# Altium project Gear_Trak-v1.0.PrjPcb (part 3 of 3)

## Sheet 3.MCU NRF52840.SchDoc: Thingy:91 nRF52840 MCU
size A4; Organization: Nordic Semiconductor; DocumentNumber: 3; SheetNumber: 3; SheetTotal: 6; CompanyName: Nordic Semiconductor; DocumentSize: A3; ProjectName: Gear_Trak-v1.0.PrjPcb
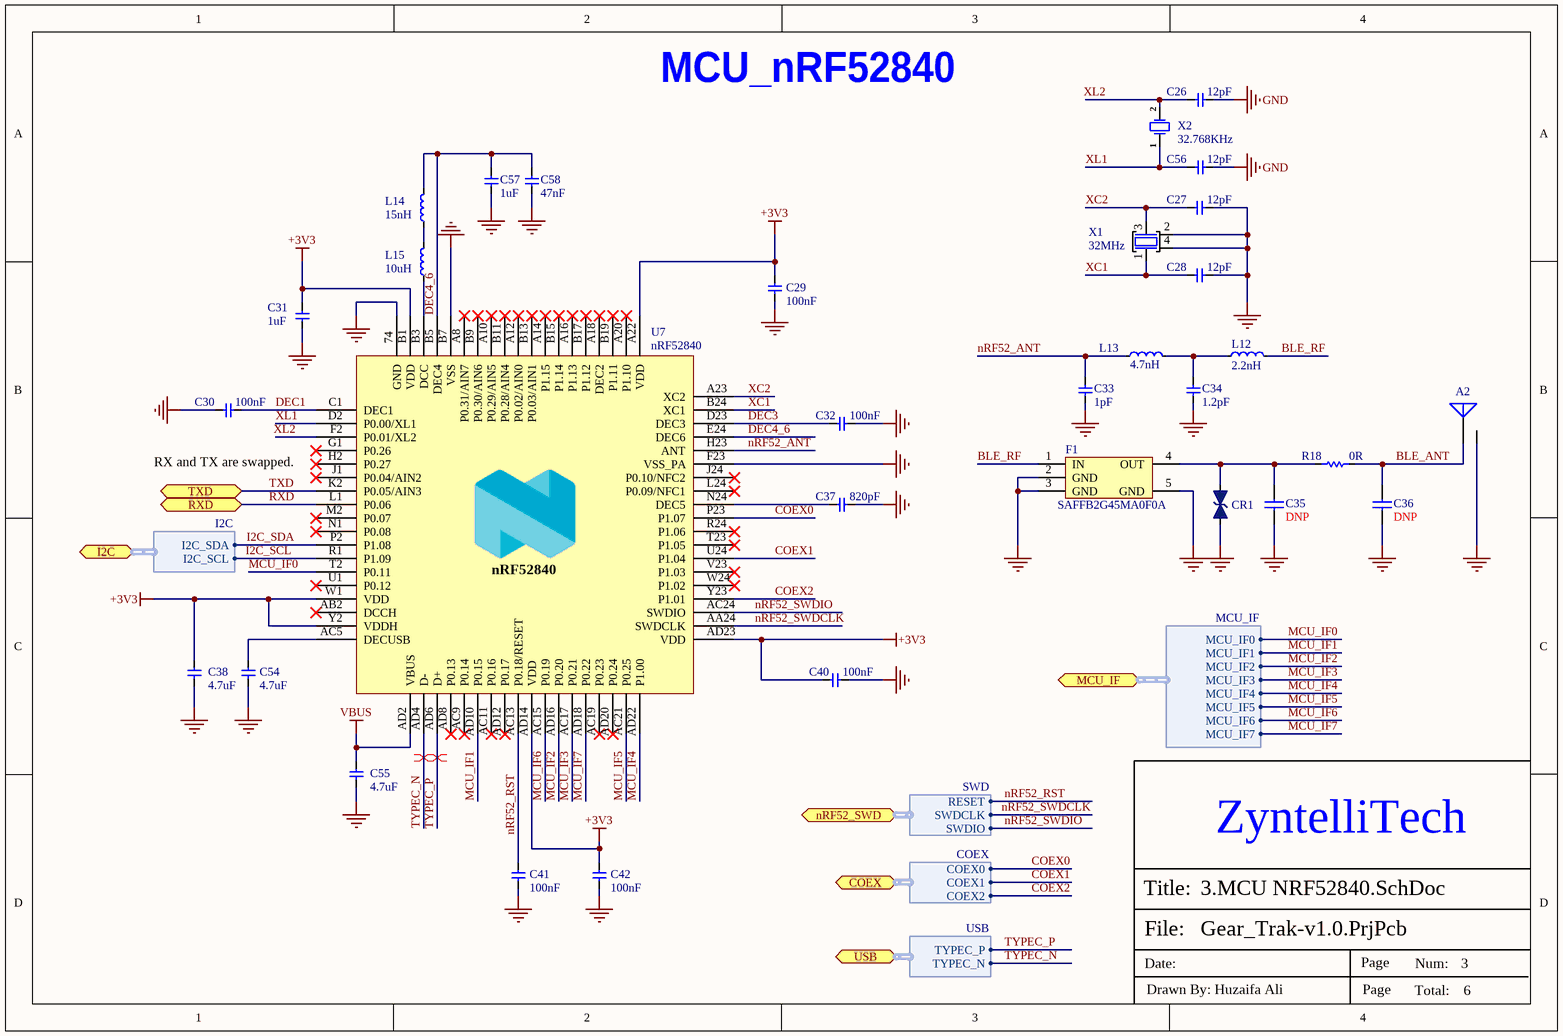
[diagram p3: 3.MCU NRF52840.SchDoc]

### Parts
A2  2450AT18D0100E  [2450AT18D0100E]  (value not drawn)
C26  12pF  [Cap-0402]
C27  12pF  [Cap-0402]
C28  12pF  [Cap-0402]
C29  100nF  [cap-0402]
C30  100nF  [cap-0402]
C31  1uF  [Cap-0402]
C32  100nF  [cap-0402]
C33  1pF  [Cap-0402]
C34  1.2pF  [Cap-0402]
C35  DNP  [CAPC0603X03L_C]
C36  DNP  [CAPC0603X03L_C]
C37  820pF  [Cap-0402]
C38  4.7uF  [Cap-0402]
C40  100nF  [cap-0402]
C41  100nF  [cap-0402]
C42  100nF  [cap-0402]
C54  4.7uF  [Cap-0402]
C55  4.7uF  [Cap-0402]
C56  12pF  [Cap-0402]
C57  1uF  [Cap-0402]
C58  47nF  [Cap-0402]
CR1  EZA-EG1N50AC  [RESC0603X03L_C]  (value not drawn)
F1  SAFFB2G45MA0F0A  [SAFFB2G45MA0F0A]
L12  2.2nH  [INDC0603X03L_C]
L13  4.7nH  [INDC0603X03L_C]
L14  15nH  [IND-0402]
L15  10uH  [IND-0603 (1608 Metric)]
R18  0R  [Res-0402]
U7  nRF52840  [AQFN50P700X700X85_HS-74N]
X1  32MHz  [BT-XTAL_2016]
X2  32.768KHz  [SMD3215-2P]

### Ports
COEX (bidir, harness COEX), I2C (bidir, harness I2C), MCU_IF (bidir, harness MCU_IF), nRF52_SWD (bidir, harness SWD), RXD (bidir), TXD (bidir), USB (bidir, harness USB)

### Harnesses
COEX: COEX2, COEX1, COEX0
SWD: SWDIO, SWDCLK, RESET
I2C: I2C_SCL, I2C_SDA
USB: TYPEC_N, TYPEC_P
MCU_IF: MCU_IF2, MCU_IF1, MCU_IF3, MCU_IF4, MCU_IF5, MCU_IF6, MCU_IF0, MCU_IF7

### Nets
+3V3: C29.1 C31.2 C38.1 C40.1 C42.1 U7.A22(VDD) U7.AD14(VDD) U7.AD23(VDD) U7.B1(VDD) U7.W1(VDD) U7.Y2(VDDH)
GND: A2.2(GND) C26.1 C27.2 C28.2 C29.2 C30.2 C31.1 C32.2 C33.1 C34.1 C35.1 C36.1 C37.2 C38.2 C40.2 C41.2 C42.2 C54.2 C55.2 C56.1 C57.1 C58.1 CR1.1 F1.2(GND) F1.3(GND) F1.5(GND) U7.74(GND) U7.B7(VSS) U7.F23(VSS_PA) X1.2(GND) X1.4(GND)
VBUS: C55.1 U7.AD2(VBUS)
BLE_ANT: A2.1(FEED) C36.2 R18.1
BLE_RF: F1.1(IN) L12.2
COEX0: U7.P23(P1.07) ; port COEX.COEX0
COEX1: U7.U24(P1.04) ; port COEX.COEX1
COEX2: U7.Y23(P1.01) ; port COEX.COEX2
DEC1: C30.1 U7.C1(DEC1)
DEC3: C32.1 U7.D23(DEC3)
DEC4_6: C57.2 C58.2 L14.2 U7.B5(DEC4) U7.E24(DEC6)
I2C_SCL: U7.R1(P1.09) ; port I2C.I2C_SCL
I2C_SDA: U7.P2(P1.08) ; port I2C.I2C_SDA
MCU_IF0: U7.T2(P0.11) ; port MCU_IF.MCU_IF0
MCU_IF1: U7.AD10(P0.15) ; port MCU_IF.MCU_IF1
MCU_IF2: U7.AD16(P0.20) ; port MCU_IF.MCU_IF2
MCU_IF3: U7.AC17(P0.21) ; port MCU_IF.MCU_IF3
MCU_IF4: U7.AD22(P1.00) ; port MCU_IF.MCU_IF4
MCU_IF5: U7.AC21(P0.25) ; port MCU_IF.MCU_IF5
MCU_IF6: U7.AC15(P0.19) ; port MCU_IF.MCU_IF6
MCU_IF7: U7.AD18(P0.22) ; port MCU_IF.MCU_IF7
nRF52_ANT: C33.2 L13.1 U7.H23(ANT)
nRF52_RST: C41.1 U7.AC13(P0.18/RESET) ; port nRF52_SWD.RESET
nRF52_SWDCLK: U7.AA24(SWDCLK) ; port nRF52_SWD.SWDCLK
nRF52_SWDIO: U7.AC24(SWDIO) ; port nRF52_SWD.SWDIO
RXD: U7.L1(P0.06) ; port RXD
TXD: U7.K2(P0.05/AIN3) ; port TXD
TYPEC_N: U7.AD4(D-) ; port USB.TYPEC_N
TYPEC_P: U7.AD6(D+) ; port USB.TYPEC_P
XC1: C28.1 U7.B24(XC1) X1.1(IN)
XC2: C27.1 U7.A23(XC2) X1.3(OUT)
XL1: C56.2 U7.D2(P0.00/XL1) X2.1(OSC1)
XL2: C26.2 U7.F2(P0.01/XL2) X2.2(OSC2)
NetC34_2: C34.2 L12.1 L13.2
NetC35_2: C35.2 CR1.2 F1.4(OUT) R18.2
NetC37_1: C37.1 U7.N24(DEC5)
NetC54_1: C54.1 U7.AC5(DECUSB)
NetL14_1: L14.1 L15.2
NetL15_1: L15.1 U7.B3(DCC)

Not connected (* = marked no-connect by the designer): U7 A8(P0.31/AIN7)* A10(P0.29/AIN5)* A12(P0.02/AIN0)* A14(P1.15)* A16(P1.13)* A18(DEC2)* A20(P1.10)* AB2(DCCH)* AC9(P0.14)* AC11(P0.16)* AC19(P0.23)* AD8(P0.13)* AD12(P0.17)* AD20(P0.24)* B9(P0.30/AIN6)* B11(P0.28/AIN4)* B13(P0.03/AIN1)* B15(P1.14)* B17(P1.12)* B19(P1.11)* G1(P0.26)* H2(P0.27)* J1(P0.04/AIN2)* J24(P0.10/NFC2)* L24(P0.09/NFC1)* M2(P0.07)* N1(P0.08)* R24(P1.06)* T23(P1.05)* U1(P0.12)* V23(P1.03)* W24(P1.02)*

### Layout directives
differential pair; differential pair class USB: TYPEC_N, TYPEC_P

### Notes on the sheet
- MCU_nRF52840
- RX and TX are swapped.
- ZyntelliTech
- File:
- Title:
- Date:
- Page
- Num:
- Total:
- Drawn By: Huzaifa Ali

### Library data of the parts
A2 = 2450AT18D0100E: 1.5dBi Chip Antenna 2.4GHz 2W 1206 Antennas ROHS; Manufacturer: Johanson; Item Type: RF Antennas; Clock Frequency: 2.5GHz; Supplier: Arrow Electronics; Supplier Part Number: 2450AT18D0100E; Manufacturer Part Number: 2450AT18D0100E; RoHS: Yes; Stock: 27000; Pricing: 3000=0.2354, 6000=0.2331, 9000=0.2244 (USD); Min Operating Temperature: -40°C; Max Operating Temperature: 125°C; ComponentLink1URL: https://datasheet.ciiva.com/29647/2450at18d0100-29647392.pdf?src-supplier=Digikey; ComponentLink1Description: https://datasheet.ciiva.com/29647/2450at18d0100-29647392.pdf?src-supplier=Digikey; ComponentLink2URL: https://datasheet.ciiva.com/24046/antenna-2450at18d0100-v3-258090-24046431.pdf?src-supplier=Mouser; ComponentLink2Description: https://datasheet.ciiva.com/24046/antenna-2450at18d0100-v3-258090-24046431.pdf?src-supplier=Mouser
C26-C28 C56 = GJM1555C1H120GB01D: CAP CER 12PF 50V C0G/NP0 0402; Manufacturer: Murata; Tolerance: 2%; Dielectric: C0G; ComponentLink1URL: https://datasheet.ciiva.com/11608/product-11608208.pdf?src-supplier=Avnet; ComponentLink1Description: https://datasheet.ciiva.com/11608/product-11608208.pdf?src-supplier=Avnet; ComponentLink2URL: https://datasheet.ciiva.com/29542/partnumbering-e-01-29542716.pdf?src-supplier=Digi-Key; ComponentLink2Description: https://datasheet.ciiva.com/29542/partnumbering-e-01-29542716.pdf?src-supplier=Digi-Key; Supplier 1: Digi-Key; Manufacturer Part Number: GJM1555C1H120GB01D; RoHS: Yes; Category: Ceramic Capacitors; Stock 1: 266975; Pricing 1: 1=0.18000, 10=0.12600, 50=0.07560, 100=0.06390, 500=0.04370, 1000=0.03865, 2500=0.03698, 5000=0.03361 (USD); Mount: Surface Mount; Case/Package: 0402; Case Code (Imperial): 0402; Case Code (Metric): 1005; Min Operating Temperature: -55°C; Max Operating Temperature: 125°C; Capacitance: 12pF; Voltage Rating: 50V; Voltage Rating (DC): 50V; Packaging: Tape and Reel; Package Quantity: 10000; Termination: SMD/SMT; Series: GJM; Construction: Flat; Length: 1mm; Width: 0.5mm; Height: 0.5mm; Thickness: 0.022inch; Depth: 0.5mm; Radiation Hardening: No; Lead Free: Lead Free; RoHS Compliant: Yes; ComponentLink3URL: https://datasheet.ciiva.com/29542/partnumbering-e-01-29542715.pdf?src-supplier=Digi-Key; ComponentLink3Description: https://datasheet.ciiva.com/29542/partnumbering-e-01-29542715.pdf?src-supplier=Digi-Key; ComponentLink4URL: https://datasheet.ciiva.com/29542/partnumbering-e-01-29542717.pdf?src-supplier=Digi-Key; ComponentLink4Description: https://datasheet.ciiva.com/29542/partnumbering-e-01-29542717.pdf?src-supplier=Digi-Key; Supplier Part Number 1: 490-8078-1-ND; LCSC Part Number: C161305
C29 C30 C32 C40-C42 = C1005X7R1H104KT000F: CAP CER 0.1UF 50V X7R 0402; Manufacturer: TDK; Tolerance: 10%; Voltage: 25V; Item Type: Capacitor; ComponentLink1URL: https://www.lcsc.com/product-detail/Multilayer-Ceramic-Capacitors-MLCC-SMD-SMT_TDK-C1005X7R1H104KT000F_C361198.html; ComponentLink1Description: LCSC; Supplier 1: Avnet; Manufacturer Part Number: C1005X7R1H104KT000F; RoHS: No; Category: Ceramic Capacitors; Dielectric: X7R; Supplier Part Number 1: C1005X7R1H104KT000F; LCSC Part Number: C361198
C31 = GRM155R70J105KA12J: CAP CER 1UF 6.3V X7R 0402; Manufacturer: Murata; Item Type: Capacitors; Material: 4241ConductorMaterial; Tolerance: 10%; Supplier: Mouser; LCSC Part Number: C2167130; Manufacturer Part Number: GRM155R70J105KA12J; RoHS: Yes; Stock: 273640; Pricing: 1=0.1, 10=0.01, 50=0.01, 100=0.008, 1000=0.008, 10000=0.007 (USD); Mounting Technology: Surface Mount; Case/Package: 0402; Pins: 2NUMBER; Case Code (Metric): 1005; Case Code (Imperial): 0402; Weight: 0.000212oz; Min Operating Temperature: -55°C; Max Operating Temperature: 125°C; Packaging: Tape and Reel; Value: 1uF; Voltage Rating: 6.3V; Dielectric: X7R; Termination: SMD/SMT; Voltage Rating (DC): 6.3V; Package Quantity: 50000; Series: GRM; Length: 0.039inch; Width: 0.02inch; Height: 550um; Thickness: 0.022inch; RoHS Compliant: Yes; ComponentLink1URL: http://www.mouser.com/ds/2/281/c02e-2905.pdf?src-supplier=Mouser; ComponentLink1Description: http://www.mouser.com/ds/2/281/c02e-2905.pdf?src-supplier=Mouser; ComponentLink2URL: https://datasheet.octopart.com/GRM155R70J105KA12J-Murata-datasheet-32479577.pdf?src-supplier=Future+Electronics; ComponentLink2Description: https://datasheet.octopart.com/GRM155R70J105KA12J-Murata-datasheet-32479577.pdf?src-supplier=Future+Electronics; ComponentLink3URL: https://datasheet.octopart.com/GRM155R70J105KA12J-Murata-datasheet-155345054.pdf?src-supplier=Element14; ComponentLink3Description: https://datasheet.octopart.com/GRM155R70J105KA12J-Murata-datasheet-155345054.pdf?src-supplier=Element14; ComponentLink4URL: http://search.murata.co.jp/Ceramy/image/img/A01X/G101/ENG/GRM155R70J105KA12-01.pdf?src-supplier=Digikey; ComponentLink4Description: http://search.murata.co.jp/Ceramy/image/img/A01X/G101/ENG/GRM155R70J105KA12-01.pdf?src-supplier=Digikey; ComponentLink5URL: https://datasheet.octopart.com/GRM155R70J105KA12J-Murata-datasheet-165579666.pdf?src-supplier=TME; ComponentLink5Description: https://datasheet.octopart.com/GRM155R70J105KA12J-Murata-datasheet-165579666.pdf?src-supplier=TME
C33 = CC0402BRNPO9BN1R0: CAP CER 1PF 50V C0G/NPO 0402; Manufacturer: Yageo; Temperature Coefficient: 30ppm/°C; Item Type: Capacitor; Supplier: Future Electronics; Supplier Part Number: 7847221; Manufacturer Part Number: CC0402BRNPO9BN1R0; RoHS: Yes; Category: Ceramic Capacitors; Stock: 180000; Pricing: 10000=0.0034, 40000=0.0032, 150000=0.0031, 250000=0.003, 500000=0.0028 (USD); Halogen Free: 5694HalogenFree; ComponentLink1URL: https://datasheet.ciiva.com/26862/getdatasheetpartid-403422-26862565.pdf?src-supplier=Verical; ComponentLink1Description: https://datasheet.ciiva.com/26862/getdatasheetpartid-403422-26862565.pdf?src-supplier=Verical; ComponentLink2URL: https://datasheet.ciiva.com/11587/upy-gp-np0-16v-to-50v-8-11587115.pdf?src-supplier=Avnet; ComponentLink2Description: https://datasheet.ciiva.com/11587/upy-gp-np0-16v-to-50v-8-11587115.pdf?src-supplier=Avnet; LCSC Part Number: C309455
C34 = CC0402BRNPO9BN1R2: CAP CER 1.2PF 50V C0G/NPO 0402; Manufacturer: Yageo; Item Type: Capacitor; Temperature Coefficient: 30ppm/°C; Supplier: Digikey; LCSC Part Number: C327292; Manufacturer Part Number: CC0402BRNPO9BN1R2; RoHS: Yes; Stock: 92678; Pricing: 1=0.1, 10=0.032, 50=0.0184, 100=0.0142, 500=0.01068, 1000=0.00839, 2500=0.00762, 5000=0.00702 (USD); Halogen Free: 5694HalogenFree; ComponentLink1URL: https://datasheet.ciiva.com/13386/upy-gp-np0-16v-to-50v-8-13386283.pdf?src-supplier=Mouser; ComponentLink1Description: https://datasheet.ciiva.com/13386/upy-gp-np0-16v-to-50v-8-13386283.pdf?src-supplier=Mouser; ComponentLink2URL: https://datasheet.ciiva.com/15189/getdatasheetpartid-468320-15189100.pdf?src-supplier=Verical; ComponentLink2Description: https://datasheet.ciiva.com/15189/getdatasheetpartid-468320-15189100.pdf?src-supplier=Verical; ComponentLink3URL: https://datasheet.ciiva.com/11587/upy-gp-np0-16v-to-50v-8-11587117.pdf?src-supplier=Avnet; ComponentLink3Description: https://datasheet.ciiva.com/11587/upy-gp-np0-16v-to-50v-8-11587117.pdf?src-supplier=Avnet
C35 C36 = C0201-0.7p-HQ-Murata: Ceramic Capacitor C0G, NP0 0201, ±0.1pF 25V; ComponentLink1URL: https://search.murata.co.jp/Ceramy/image/img/A01X/G101/ENG/GJM0335C1ER70BB01-01.pdf; ComponentLink1Description: Datasheet; ComponentLink2URL: https://www.murata.com/en-eu/products/productdetail?partno=GJM0335C1ER70BB01%23; ComponentLink2Description: Supplier link; LCSC: NILL
  C35: Package: 0402
  C36: Package: 0201
C37 = GCM1555C1H821JA16D: CAP CER 820PF 50V C0G/NP0 0402; Manufacturer: Murata; Item Type: Capacitors; Supplier: Mouser; LCSC Part Number: C161159; Manufacturer Part Number: GCM1555C1H821JA16D; RoHS: Yes; Stock: 40971; Pricing: 1=0.1, 10=0.029, 50=0.029, 100=0.017, 1000=0.013, 10000=0.007 (USD); ComponentLink1URL: https://datasheet.octopart.com/GCM1555C1H821JA16D-Murata-datasheet-137472381.pdf?src-supplier=Future+Electronics; ComponentLink1Description: https://datasheet.octopart.com/GCM1555C1H821JA16D-Murata-datasheet-137472381.pdf?src-supplier=Future+Electronics; ComponentLink2URL: https://datasheet.octopart.com/GCM1555C1H821JA16D-Murata-datasheet-12511495.pdf?src-supplier=TME; ComponentLink2Description: https://datasheet.octopart.com/GCM1555C1H821JA16D-Murata-datasheet-12511495.pdf?src-supplier=TME
C38 C54 C55 = CL05A475MO5NUNC: CAP CER 4.7UF 16V X5R 0402; Manufacturer: Samsung; Material: 4241ConductorMaterial; Tolerance: 20%; ComponentLink1URL: http://www.farnell.com/datasheets/2710653.pdf?src-supplier=Farnell; ComponentLink1Description: http://www.farnell.com/datasheets/2710653.pdf?src-supplier=Farnell; ComponentLink2URL: http://www.samsungsem.com/kr/support/product-search/mlcc/CL05A475MO5NUNC.jsp?src-supplier=Digikey; ComponentLink2Description: http://www.samsungsem.com/kr/support/product-search/mlcc/CL05A475MO5NUNC.jsp?src-supplier=Digikey; Supplier 1: Avnet; Manufacturer Part Number: CL05A475MO5NUNC; RoHS: Yes; Category: Ceramic Capacitors; Stock 1: 50000; Pricing 1: 10000=0.09712 (USD); Mount: Surface Mount; Case/Package: 0402; Case Code (Metric): 1005; Case Code (Imperial): 0402; Min Operating Temperature: -55°C; Max Operating Temperature: 85°C; Packaging: Cut Tape; Capacitance: 4.7uF; Voltage Rating: 16V; Series: CL; Voltage Rating (DC): 16V; Length: 0.039inch; Width: 0.02inch; Height: 550um; Thickness: 0.022inch; RoHS Compliant: Yes; ComponentLink3URL: http://www.farnell.com/datasheets/2710653.pdf?src-supplier=Element14; ComponentLink3Description: http://www.farnell.com/datasheets/2710653.pdf?src-supplier=Element14; ComponentLink4URL: https://datasheet.octopart.com/CL05A475MO5NUNC-Samsung-Electro-Mechanics-datasheet-123102911.pdf?src-supplier=Future+Electronics; ComponentLink4Description: https://datasheet.octopart.com/CL05A475MO5NUNC-Samsung-Electro-Mechanics-datasheet-123102911.pdf?src-supplier=Future+Electronics; ComponentLink5URL: http://www.farnell.com/datasheets/2710653.pdf?src-supplier=Newark; ComponentLink5Description: http://www.farnell.com/datasheets/2710653.pdf?src-supplier=Newark; Supplier Part Number 1: CL05A475MO5NUNC
C57 = CC0402KRX5R7BB105: CAP CER 1UF 16V X5R 0402; Manufacturer: Yageo; Tolerance: 10%; Item Type: Capacitor; Supplier 1: Digi-Key; Manufacturer Part Number: CC0402KRX5R7BB105; Stock 1: 1405667; Pricing 1: 1=0.36, 10=0.252, 100=0.1512, 500=0.1134, 1000=0.09576, 2500=0.09072, 5000=0.08568 (USD); Mount: Surface Mount; Case/Package: 0402; Weight: 2.3E-05oz; Case Code (Imperial): 0402; Case Code (Metric): 1005; Min Operating Temperature: -55°C; Max Operating Temperature: 85°C; Capacitance: 1uF; Dielectric: X5R; Packaging: Tape and Reel; Voltage Rating (DC): 16V; Voltage Rating: 16V; Termination: SMD/SMT; Composition: Ceramic; Length: 1mm; Height: 0.5mm; Width: 0.02inch; Thickness: 0.022inch; Depth: 0.5mm; Radiation Hardening: No; Lead Free: Lead Free; Halogen Free: Halogen Free; ComponentLink1URL: http://www.yageo.com/documents/recent/UPY-GPHC_X5R_4V-to-50V_12.pdf?src-supplier=Avnet+Europe; ComponentLink1Description: http://www.yageo.com/documents/recent/UPY-GPHC_X5R_4V-to-50V_12.pdf?src-supplier=Avnet+Europe; Supplier Part Number 1: 311-1691-6-ND; LCSC Part Number: C325464
C58 = CC0402KRX7R9BB473: CAP CER 0.047UF 50V X7R 0402; Manufacturer: Yageo; Material: 4241ConductorMaterial; Tolerance: 10%; Temperature Coefficient: 30ppm/°C; Dielectric: 1511DielectricType; Item Type: Capacitor; Supplier: Future Electronics; Supplier Part Number: 2095687; Manufacturer Part Number: CC0402KRX7R9BB473; RoHS: Yes; Category: Ceramic Capacitors; Stock: 1130000; Pricing: 10000=0.0044, 40000=0.0042, 100000=0.004, 150000=0.0041, 250000=0.0039, 400000=0.0037, 500000=0.0038 (USD); Mounting Technology: Surface Mount; Case/Package: 0402; Case Code (Imperial): 0402; Case Code (Metric): 1005; Min Operating Temperature: -55°C; Max Operating Temperature: 125°C; Packaging: Tape and Reel; Value: 47nF; Voltage Rating: 50V; Series: CC; Voltage Rating (DC): 50V; Length: 0.039inch; Width: 0.02inch; Height: 550um; Thickness: 0.022inch; RoHS Compliant: Yes; Halogen Free: 5694HalogenFree; Lead Free: 5697LeadFree; ComponentLink1URL: https://datasheet.octopart.com/CC0402KRX7R9BB473-Yageo-datasheet-166511530.pdf?src-supplier=Future+Electronics; ComponentLink1Description: https://datasheet.octopart.com/CC0402KRX7R9BB473-Yageo-datasheet-166511530.pdf?src-supplier=Future+Electronics; ComponentLink2URL: http://www.yageo.com/documents/recent/UPY-GPHC_X7R_6.3V-to-50V_18.pdf?src-supplier=Digikey; ComponentLink2Description: http://www.yageo.com/documents/recent/UPY-GPHC_X7R_6.3V-to-50V_18.pdf?src-supplier=Digikey; ComponentLink3URL: https://datasheet.octopart.com/CC0402KRX7R9BB473-Yageo-datasheet-140260305.pdf?src-supplier=Newark; ComponentLink3Description: https://datasheet.octopart.com/CC0402KRX7R9BB473-Yageo-datasheet-140260305.pdf?src-supplier=Newark; LCSC Part Number: C272875
CR1 = EZA-EG1N50AC: ESD Suppressor, 30V, 0.04pF; Manufacturer: Panasonic; Part number IPS: 00000004437; Note: N.A.; Pad Count: 2; Part Number: EZA-EG1N50AC; Manufacturer Part Number: EZA-EG1N50AC; ComponentLink1URL: https://industrial.panasonic.com/cdbs/www-data/pdf/AWD0000/AWD0000C13.pdf; ComponentLink1Description: Datasheet; ComponentLink2URL: N.A.; ComponentLink2Description: Supplier link; HelpURL: N.A.; Footprint Doc: 0201; LatestRevisionDate: 2020-04-28; Published: 2020-02-06; Value: EZA-EG1N50AC; Artikkelnr Noca: N.A.; Supplier 1: Digi-Key; Digikey Part Number: P122037CT-ND; Supplier 2: N.A.; Supplier Part Number 2: N.A.; Component Class: Semiconductors; PartId: 101300173; LCSC: Not Available
F1 = SAFFB2G45MA0F0A: 2.4 GHz BPF; Manufacturer: Murata; Part number IPS: 00000001784, 80000001660; Artikkelnr Noca: N.A.; Pad Count: 5; Part Number: SAFFB2G45MA0F0A; Manufacturer Part Number: SAFFB2G45MA0F0A; ComponentLink1URL: N.A.; ComponentLink1Description: Datasheet; ComponentLink2URL: N.A.; ComponentLink2Description: Supplier link; HelpURL: N.A.; Footprint Doc: 1109; LatestRevisionDate: 2018-05-15; Published: 2018-05-15; Value: SAFFB2G45MA0F0A; Supplier 1: N.A.; Supplier Part Number 1: N.A.; Supplier 2: N.A.; Supplier Part Number 2: N.A.; Component Class: Filters; PartId: 100800023; Note: N.A.; LCSC: C910680
L12 = L0201-3n9: Inductor, 400mA, ±0.1nH; Manufacturer: Murata; Manufacturer Part Number: LQP03TN3N9B02D; Part number IPS: 00000001253; Value: 3.9nH; Note: N.A.; Pad Count: 2; Part Number: L0201-3n9; LatestRevisionDate: 2017-11-09; Published: 2013-04-10; Footprint Doc: 0201; ComponentLink1URL: N.A.; ComponentLink1Description: Datasheet; ComponentLink2URL: N.A.; ComponentLink2Description: Supplier link; HelpURL: N.A.; Supplier 1: N.A.; Supplier Part Number 1: N.A.; Supplier 2: N.A.; Supplier Part Number 2: N.A.; Artikkelnr Noca: N.A.; Component Class: Inductors; PartId: 100300022; LCSC: C90191
L13 = L0201-4n7: Inductor, 350mA, ±3%; Package: 0201; ComponentLink1Description: Datasheet; ComponentLink2Description: Supplier link; ComponentLink1URL: N.A.; ComponentLink2URL: N.A.; LCSC: C86126
L14 = LQG15HN15NJ02D: FIXED IND 15NH 400MA 0.45OHM SMD; Manufacturer: Murata; Item Type: Inductor; Core Material: Air; Current Rating: 300mA; Tolerance: 5%; Q Factor: 8; Self Resonant Frequency: 2.3GHz; Shielding: Unshielded; DC Resistance (DCR): 460mR; Test Frequency: 100MHz; ESR: 450mR; Supplier: Mouser; LCSC Part Number: C97979; Manufacturer Part Number: LQG15HN15NJ02D; RoHS: Yes; Stock: 45308; Pricing: 1=0.1, 10=0.037, 50=0.037, 100=0.029, 1000=0.022, 10000=0.018 (USD); Mounting Technology: Surface Mount; Case/Package: 0402; Case Code (Metric): 1005; Case Code (Imperial): 0402; Min Operating Temperature: -55°C; Max Operating Temperature: 125°C; Packaging: Tape and Reel; Package Quantity: 1; Termination: SMD/SMT; Series: LQG15HS; Inductance Tolerance: 5%; Value: 15nH; Max DC Current: 300mA; DC Current: 300mA; Max Current Rating: 300mA; Length: 0.039inch; Width: 0.02inch; Height: 0.5mm; Height - Seated (Max): 0.022inch; Depth: 0.55mm; Reach SVHC Compliant: No; RoHS Compliant: Yes; Military Standard: Not; ComponentLink1URL: https://datasheet.ciiva.com/11801/0900766b80f10808-11801397.pdf?src-supplier=Rs; ComponentLink1Description: https://datasheet.ciiva.com/11801/0900766b80f10808-11801397.pdf?src-supplier=Rs; ComponentLink2URL: https://datasheet.ciiva.com/8002/66026-8002488.pdf?src-supplier=Element14; ComponentLink2Description: https://datasheet.ciiva.com/8002/66026-8002488.pdf?src-supplier=Element14; ComponentLink3URL: https://datasheet.ciiva.com/29696/l0075s0083lqg15hn-29696702.pdf?src-supplier=Digikey; ComponentLink3Description: https://datasheet.ciiva.com/29696/l0075s0083lqg15hn-29696702.pdf?src-supplier=Digikey; ComponentLink4URL: https://datasheet.ciiva.com/1063/l0075s0083lqg15hn-1063850.pdf?src-supplier=Digikey; ComponentLink4Description: https://datasheet.ciiva.com/1063/l0075s0083lqg15hn-1063850.pdf?src-supplier=Digikey; ComponentLink5URL: https://datasheet.ciiva.com/29696/l0075s0083lqg15hn-29696703.pdf?src-supplier=Digikey; ComponentLink5Description: https://datasheet.ciiva.com/29696/l0075s0083lqg15hn-29696703.pdf?src-supplier=Digikey
L15 = MLZ1608M100WT000: FIXED IND 10UH 250MA 1.05OHM SMD; Manufacturer: TDK; Item Type: Inductors; Core Material: Ferrite; Tolerance: 20%; Saturation Current: 90mA; Shielding: Shielded; Value: 1.05R; DC Resistance (DCR): 1.365R; Self Resonant Frequency: 50MHz; Test Frequency: 2MHz; Supplier: Digikey; LCSC Part Number: C76798; Manufacturer Part Number: MLZ1608M100WT000; RoHS: Yes; Stock: 146199; Pricing: 1=0.14, 10=0.09, 25=0.0804, 50=0.0706, 100=0.0617, 250=0.05292 (USD); Mounting Technology: Surface Mount; Case/Package: 0603; Case Code (Metric): 1608; Case Code (Imperial): 0603; Min Operating Temperature: -55°C; Max Operating Temperature: 125°C; Package Quantity: 4000; Packaging: Cut Tape; Current Rating: 250mA; Series: MLZ; RMS Current (Irms): 250mA; ESR: 1.05R; Length: 0.063inch; Width: 0.031inch; Height: 950um; Height - Seated (Max): 0.037inch; RoHS Compliant: Yes; ComponentLink1URL: https://product.tdk.com/info/en/catalog/datasheets/inductor_commercial_decoupling_mlz1608_en.pdf?src-supplier=Digikey; ComponentLink1Description: https://product.tdk.com/info/en/catalog/datasheets/inductor_commercial_decoupling_mlz1608_en.pdf?src-supplier=Digikey; ComponentLink2URL: https://datasheet.octopart.com/MLZ1608M100WT000-TDK-datasheet-12356712.pdf?src-supplier=Newark; ComponentLink2Description: https://datasheet.octopart.com/MLZ1608M100WT000-TDK-datasheet-12356712.pdf?src-supplier=Newark; ComponentLink3URL: https://datasheet.octopart.com/MLZ1608M100WT000-TDK-datasheet-38159369.pdf?src-supplier=Future+Electronics; ComponentLink3Description: https://datasheet.octopart.com/MLZ1608M100WT000-TDK-datasheet-38159369.pdf?src-supplier=Future+Electronics
R18 = RC0402FR-070RL: RES 0 OHM JUMPER 1/16W 0402; Manufacturer: Yageo; Item Type: Resistors; Tolerance: 1%; Power Rating: 62.5mW; Voltage Rating: 50V; Temperature Coefficient: 200ppm/°C; Max Power Dissipation: 63mW; Supplier 1: Mouser; Manufacturer Part Number: RC0402FR-070RL; RoHS: Yes; Stock 1: 8556842; Pricing 1: 1=0.10000, 10=0.01400, 50=0.01400, 100=0.00600, 1000=0.00300, 5000=0.00200, 10000=0.00100 (USD); Mount: Surface Mount; Case/Package: 0402; Contact Plating: Tin,Matte; Case Code (Imperial): 0402; Case Code (Metric): 1005; Size Code: 0402; Min Operating Temperature: -55°C; Max Operating Temperature: 155°C; Resistance: 0R; Resistor Type: Thick Film; Packaging: Tape and Reel; Termination: SMD/SMT; Features: Moisture Resistant; Series: RC; Number of Terminations: 2; Length: 1mm; Width: 0.5mm; Height: 0.35mm; Radiation Hardening: No; Lead Free: Lead Free; RoHS Compliant: Yes; ComponentLink1URL: https://datasheet.ciiva.com/8896/pyu-rc0402-51-rohs-l-6-8896149.pdf?src-supplier=Avnet; ComponentLink1Description: https://datasheet.ciiva.com/8896/pyu-rc0402-51-rohs-l-6-8896149.pdf?src-supplier=Avnet; ComponentLink2URL: https://datasheet.ciiva.com/16790/pyu-rc0402-51-rohs-l-6-r-16790444.pdf?src-supplier=Future+Electronics; ComponentLink2Description: https://datasheet.ciiva.com/16790/pyu-rc0402-51-rohs-l-6-r-16790444.pdf?src-supplier=Future+Electronics; Supplier Part Number 1: 603-RC0402FR-070RL; LCSC Part Number: C106231
U7 = nRF52840: AQFN-73-EP(7x7) RF Transceiver ICs ROHS; LCSC: C190794; Package: QFN-73
X1 = XTAL_SMD2016_32MHz_8pF_Murata: XTAL SMD 2016, 32MHz, Cl=8pF, Tol: ±10ppm, Stab: ±10ppm; ComponentLink1Description: Datasheet; ComponentLink1URL: N.A.; ComponentLink2Description: Supplier link; ComponentLink2URL: N.A.; Package: SMD-2016; LCSC: C2965582
X2 = Q13FC13500049: Crystal, 32.768KHZ, 6PF, 3.2MM X 1.5MM Rohs Compliant: Yes; Manufacturer: Epson; Supplier: Farnell; LCSC Part Number: C95361; Manufacturer Part Number: Q13FC13500049; RoHS: No; Item Type: Crystal; Stock: 760; Pricing: 100=5.52, 250=5.41 (DKK)

## Sheet 5.RGB_TEMP-HUMIDITY.SchDoc
size A4; DocumentNumber: 5; SheetNumber: 5
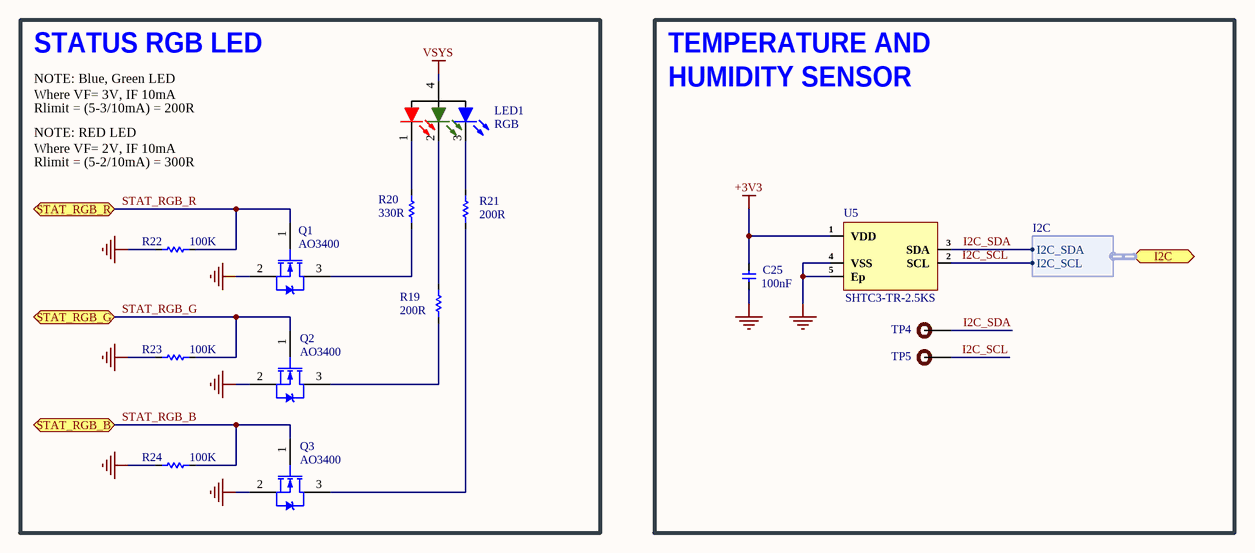
[diagram p4: 5.RGB_TEMP-HUMIDITY.SchDoc]

### Parts
C25  100nF  [cap-0402]
LED1  RGB  [LED_RGB_0606]
Q1  AO3400  [SOT-23a]
Q2  AO3400  [SOT-23a]
Q3  AO3400  [SOT-23a]
R19  200R  [Res-0402]
R20  330R  [Res-0402]
R21  200R  [Res-0402]
R22  100K  [Res-0402]
R23  100K  [Res-0402]
R24  100K  [Res-0402]
TP4  TEST POINT 0.5mm Dia  [Test-point - 0.5mm]  (value not drawn)  (no BOM)
TP5  TEST POINT 0.5mm Dia  [Test-point - 0.5mm]  (value not drawn)  (no BOM)
U5  SHTC3-TR-2.5KS  [4-WDFN Exposed Pad]

### Blocks framed on the sheet
STATUS RGB LED: LED1 Q1-Q3 R19-R24

### Ports
I2C (bidir, harness I2C), STAT_RGB_B (bidir), STAT_RGB_G (bidir), STAT_RGB_R (bidir)

### Harnesses
I2C: I2C_SCL, I2C_SDA

### Nets
+3V3: C25.1 U5.1(VDD)
GND: C25.2 Q1.2(S) Q2.2(S) Q3.2(S) R22.1 R23.1 R24.1 U5.4(VSS) U5.5(Ep)
VSYS: LED1.4(+)
I2C_SCL: TP5.1 U5.2(SCL) ; port I2C.I2C_SCL
I2C_SDA: TP4.1 U5.3(SDA) ; port I2C.I2C_SDA
STAT_RGB_B: Q3.1(G) R24.2 ; port STAT_RGB_B
STAT_RGB_G: Q2.1(G) R23.2 ; port STAT_RGB_G
STAT_RGB_R: Q1.1(G) R22.2 ; port STAT_RGB_R
NetLED1_1: LED1.1(R-) R20.2
NetLED1_2: LED1.2(G-) R19.2
NetLED1_3: LED1.3(B-) R21.2
NetQ1_3: Q1.3(D) R20.1
NetQ2_3: Q2.3(D) R19.1
NetQ3_3: Q3.3(D) R21.1

### Notes on the sheet
- NOTE: Blue, Green LED
- Where VF= 3V, IF 10mA
- Rlimit = (5-3/10mA) = 200R
- TEMPERATURE AND
- HUMIDITY SENSOR
- NOTE: RED LED
- Where VF= 2V, IF 10mA
- Rlimit = (5-2/10mA) = 300R
- ZyntelliTech
- File:
- Title:
- Date:
- Page
- Num:
- Total:
- Drawn By: Huzaifa Ali

### Library data of the parts
C25 = C1005X7R1H104KT000F: as C29 on sheet 3.MCU NRF52840; ComponentLink1URL: https://www.lcsc.com/product-detail/Multilayer-Ceramic-Capacitors-MLCC-SMD-SMT_TDK-C1005X7R1H104KT000F_C361198.html; ComponentLink1Description: LCSC; Supplier 1: Avnet; Manufacturer Part Number: C1005X7R1H104KT000F; RoHS: No; Category: Ceramic Capacitors; Dielectric: X7R; Supplier Part Number 1: C1005X7R1H104KT000F; LCSC Part Number: C361198
LED1 = LTST-C19HE1WT: LCSC: C458749
Q1-Q3 = NMOS-2: 30V 5.8A 35mΩ@10V,5.8A 350mW N Channel SOT-23 MOSFETs ROHS; LCSC: C181090; ComponentLink1Description: Manufacturer Link; ComponentLink1URL: http://www.irf.com/
R19 R21 = RC0402FR-07200RL: RES 200 OHM 1% 1/16W 0402; Manufacturer: Yageo; Temperature Coefficient: 100ppm/°C; Power Rating: 63mW; Voltage Rating (DC): 50V; ComponentLink1URL: https://datasheet.ciiva.com/2553/pyu-r-int-thick-7-2553232.pdf?src-supplier=Digi-Key; ComponentLink1Description: https://datasheet.ciiva.com/2553/pyu-r-int-thick-7-2553232.pdf?src-supplier=Digi-Key; ComponentLink2URL: https://datasheet.ciiva.com/7983/1018594-7983509.pdf?src-supplier=Element14; ComponentLink2Description: https://datasheet.ciiva.com/7983/1018594-7983509.pdf?src-supplier=Element14; Supplier 1: Digi-Key; Manufacturer Part Number: RC0402FR-07200RL; RoHS: Yes; Category: Chip SMD Resistors; Stock 1: 19778; Pricing 1: 1=0.10000, 10=0.01600, 100=0.00660, 1000=0.00299, 2500=0.00259, 5000=0.00214 (USD); Case/Package: 0402; Case Code (Metric): 1005; Case Code (Imperial): 0402; Size Code: 0402; Min Operating Temperature: -55°C; Max Operating Temperature: 155°C; Tolerance: 1%; Resistance: 200R; Resistor Type: Thick Film; Packaging: Tape and Reel; Voltage Rating: 50V; Package Quantity: 1; Number of Terminations: 2; Termination: SMD/SMT; Max Power Dissipation: 63mW; Features: Moisture Resistant; Series: RC; Construction: Rectangular; Resistance Tolerance: 1%; Length: 1mm; Width: 0.02inch; Height: 0.016inch; Depth: 0.5mm; REACH SVHC: No SVHC; Lead Free: Lead Free; RoHS Compliant: Yes; Military Standard: Not; ComponentLink3URL: https://datasheet.ciiva.com/16804/pyu-rc0402-51-rohs-l-6-r-16804406.pdf?src-supplier=Future+Electronics; ComponentLink3Description: https://datasheet.ciiva.com/16804/pyu-rc0402-51-rohs-l-6-r-16804406.pdf?src-supplier=Future+Electronics; ComponentLink4URL: https://datasheet.ciiva.com/15189/getdatasheetpartid-331152-15189383.pdf?src-supplier=Verical; ComponentLink4Description: https://datasheet.ciiva.com/15189/getdatasheetpartid-331152-15189383.pdf?src-supplier=Verical; ComponentLink5URL: https://datasheet.ciiva.com/7849/1018594-7849898.pdf?src-supplier=Element14; ComponentLink5Description: https://datasheet.ciiva.com/7849/1018594-7849898.pdf?src-supplier=Element14; ComponentLink6URL: https://datasheet.ciiva.com/5562/pyu-rc0402-51-rohs-l-6-r-8721-5562539.pdf?src-supplier=Mouser; ComponentLink6Description: https://datasheet.ciiva.com/5562/pyu-rc0402-51-rohs-l-6-r-8721-5562539.pdf?src-supplier=Mouser; ComponentLink7URL: https://datasheet.ciiva.com/7849/1018594-7849899.pdf?src-supplier=Element14; ComponentLink7Description: https://datasheet.ciiva.com/7849/1018594-7849899.pdf?src-supplier=Element14; ComponentLink8URL: https://datasheet.ciiva.com/2553/pyu-r-int-thick-7-2553230.pdf?src-supplier=Digi-Key; ComponentLink8Description: https://datasheet.ciiva.com/2553/pyu-r-int-thick-7-2553230.pdf?src-supplier=Digi-Key; ComponentLink9URL: https://datasheet.ciiva.com/2553/pyu-r-int-thick-7-2553231.pdf?src-supplier=Digi-Key; ComponentLink9Description: https://datasheet.ciiva.com/2553/pyu-r-int-thick-7-2553231.pdf?src-supplier=Digi-Key; Supplier Part Number 1: 311-200LRCT-ND; LCSC Part Number: C114764
R20 = RK73H1ETTP3300F: RES 330 OHM 1% 1/10W 0402; Manufacturer: KOA Speer; Power Rating: 63mW; Voltage Rating: 50V; Temperature Coefficient: 100ppm/°C; Max Power Dissipation: 100mW; Supplier: Rs; Supplier Part Number: 6317972; Manufacturer Part Number: RK73H1ETTP3300F; RoHS: Yes; Category: Chip SMD Resistors; Stock: 36500; Pricing: 100=0.007, 1000=0.006, 2500=0.006, 5000=0.006, 10000=0.005 (GBP); Case/Package: 0402; Case Code (Imperial): 0402; Case Code (Metric): 1005; Min Operating Temperature: -55°C; Max Operating Temperature: 155°C; Value: 330R; Tolerance: 1%; Packaging: Tape and Reel; Package Quantity: 10000; Termination: SMD/SMT; Voltage Rating (DC): 50V; Series: RK73H; Construction: Rectangular; Features: Moisture Resistant,Automotive AEC-Q200; Number of Terminations: 2; Length: 1mm; Width: 0.5mm; Height: 0.35mm; LCSC Part Number: C159971; Ratings: AEC-Q200; Military Standard: Not; Lead Free: Lead Free; RoHS Compliant: Yes; ComponentLink1URL: https://datasheet.ciiva.com/5555/rk73h-5555909.pdf?src-supplier=Mouser; ComponentLink1Description: https://datasheet.ciiva.com/5555/rk73h-5555909.pdf?src-supplier=Mouser; ComponentLink2URL: https://datasheet.ciiva.com/15203/getdatasheetpartid-424481-15203100.pdf?src-supplier=Verical; ComponentLink2Description: https://datasheet.ciiva.com/15203/getdatasheetpartid-424481-15203100.pdf?src-supplier=Verical
R22-R24 = RC0402FR-07100KL: RES 100K OHM 1% 1/16W 0402; Manufacturer: Yageo; Temperature Coefficient: 100ppm/°C; Power Rating: 63mW; Voltage Rating: 50V; Item Type: Resistor; Resistance: 100kR; RoHS: Yes; Category: Chip SMD Resistors; Case/Package: 0402; Case Code (Metric): 1005; Case Code (Imperial): 0402; Min Operating Temperature: -55°C; Max Operating Temperature: 155°C; Resistor Type: Thick Film; Tolerance: 1%; Packaging: Tape and Reel; Features: Moisture Resistant; Resistance Tolerance: 1%; Height: 0.016inch; Lead Free: Lead Free; RoHS Compliant: Yes; ComponentLink1URL: https://datasheet.ciiva.com/11819/0900766b80c66297-11819452.pdf?src-supplier=RSComponents; ComponentLink1Description: https://datasheet.ciiva.com/11819/0900766b80c66297-11819452.pdf?src-supplier=RSComponents; ComponentLink2URL: https://datasheet.ciiva.com/22747/1018594-22747509.pdf?src-supplier=Element14; ComponentLink2Description: https://datasheet.ciiva.com/22747/1018594-22747509.pdf?src-supplier=Element14; ComponentLink3URL: https://datasheet.ciiva.com/2453/pyu-r-int-thick-7-2453362.pdf?src-supplier=Digi-Key; ComponentLink3Description: https://datasheet.ciiva.com/2453/pyu-r-int-thick-7-2453362.pdf?src-supplier=Digi-Key; ComponentLink4URL: https://datasheet.ciiva.com/2453/pyu-r-int-thick-7-2453363.pdf?src-supplier=Digi-Key; ComponentLink4Description: https://datasheet.ciiva.com/2453/pyu-r-int-thick-7-2453363.pdf?src-supplier=Digi-Key; ComponentLink5URL: https://datasheet.ciiva.com/2453/pyu-r-int-thick-7-2453361.pdf?src-supplier=Digi-Key; ComponentLink5Description: https://datasheet.ciiva.com/2453/pyu-r-int-thick-7-2453361.pdf?src-supplier=Digi-Key; ComponentLink6URL: https://datasheet.ciiva.com/12667/pyu-rc0402-51-rohs-l-6-r-12667930.pdf?src-supplier=Mouser; ComponentLink6Description: https://datasheet.ciiva.com/12667/pyu-rc0402-51-rohs-l-6-r-12667930.pdf?src-supplier=Mouser; ComponentLink7URL: https://datasheet.ciiva.com/15189/getdatasheetpartid-323696-15189334.pdf?src-supplier=Verical; ComponentLink7Description: https://datasheet.ciiva.com/15189/getdatasheetpartid-323696-15189334.pdf?src-supplier=Verical; LCSC Part Number: C60491; Supplier 1: Mouser; Manufacturer Part Number: RC0402FR-07100KL; Stock 1: 7759549; Pricing 1: 1=0.10000, 10=0.01200, 50=0.01200, 100=0.00500, 1000=0.00300, 2500=0.00200, 10000=0.00100 (USD); Package Quantity: 1; Number of Terminations: 2; Termination: SMD/SMT; Max Power Dissipation: 63mW; Working Voltage: 50V; Series: RC; Construction: Rectangular; Technology: THICK FILM; Length: 0.039inch; Width: 0.02inch; Depth: 0.5mm; REACH SVHC: No SVHC; Military Standard: Not; Supplier Part Number 1: 603-RC0402FR-07100KL
TP4 TP5 = TEST POINT 0.5mm Dia: Test Point ON; Item Type: Test Point; Manufacturer Part Number: TEST POINT 0.5mm Dia
U5 = SHTC3-TR-2.5KS: SHTC3 Series Digital ±2% RH SMT Humidity Temperature Sensor - DFN-8; Manufacturer: Sensirion; Item Type: IC; Supplier: Digikey; LCSC Part Number: C194656; Manufacturer Part Number: SHTC3-TR-2.5KS; RoHS: No; Stock: 21685; Pricing: 1=2.72, 5=2.292, 10=2.129, 25=1.932, 50=1.7952, 100=1.6682, 500=1.40712, 1000=1.30776 (USD); ComponentLink1URL: https://datasheet.octopart.com/SHTC3-TR-2.5KS-Sensirion-datasheet-166628637.pdf?src-supplier=Future+Electronics; ComponentLink1Description: https://datasheet.octopart.com/SHTC3-TR-2.5KS-Sensirion-datasheet-166628637.pdf?src-supplier=Future+Electronics

## Sheet 6.Connectors.SchDoc
size A4; DocumentNumber: 6; SheetNumber: 6
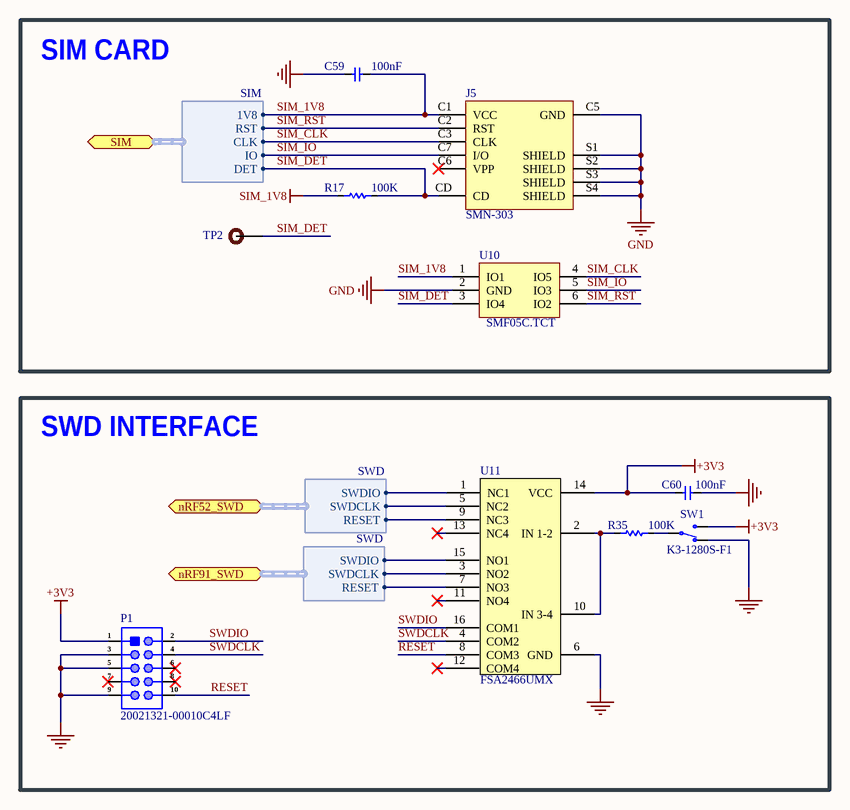
[diagram p5: 6.Connectors.SchDoc]

### Parts
C59  100nF  [cap-0402]
C60  100nF  [cap-0402]
J5  SMN-303  [XUNPU_SMN-303]
P1  20021321-00010C4LF  [20021321-00010C4LF]
R17  100K  [Res-0402]
R35  100K  [Res-0402]
SW1  K3-1280S-F1  [K3-1280S-F1]
TP2  TEST POINT 0.5mm Dia  [Test-point - 0.5mm]  (value not drawn)  (no BOM)
U10  SMF05C.TCT  [SOT65P210X110-6N]
U11  FSA2466UMX  [XQFN40P180X260X50-16N]

### Blocks framed on the sheet
SIM CARD: C59 J5 R17 TP2 U10
SWD INTERFACE: C60 P1 R35 SW1 U11

### Ports
nRF52_SWD (bidir, harness SWD), nRF91_SWD (bidir, harness SWD), SIM (bidir, harness SIM)

### Harnesses
SIM: DET, RST, CLK, IO, 1V8
SWD: SWDIO, SWDCLK, RESET

### Nets
+3V3: C60.1 P1.1 SW1.3(N.O) U11.14(VCC)
GND: C59.1 C60.2 J5.C5(GND) J5.S1(SHIELD) J5.S2(SHIELD) J5.S3(SHIELD) J5.S4(SHIELD) P1.3 P1.5 P1.9 SW1.1(N.C) U10.2(GND) U11.6(GND)
SIM_1V8: C59.2 J5.C1(VCC) R17.1 U10.1(IO1) ; port SIM.1V8
nRF52_RST: U11.9(NC3) ; port nRF52_SWD.RESET
nRF52_SWDCLK: U11.5(NC2) ; port nRF52_SWD.SWDCLK
nRF52_SWDIO: U11.1(NC1) ; port nRF52_SWD.SWDIO
RESET: P1.10 U11.8(COM3)
SIM_CLK: J5.C3(CLK) U10.4(IO5) ; port SIM.CLK
SIM_DET: J5.CD R17.2 TP2.1 U10.3(IO4) ; port SIM.DET
SIM_IO: J5.C7(I/O) U10.5(IO3) ; port SIM.IO
SIM_RST: J5.C2(RST) U10.6(IO2) ; port SIM.RST
SWDCLK: P1.4 U11.4(COM2)
SWDIO: P1.2 U11.16(COM1)
NetR13_1: U11.7(NO3) ; port nRF91_SWD.RESET
NetR35_1: R35.1 U11.2(IN_1-2) U11.10(IN_3-4)
NetR35_2: R35.2 SW1.2(COM)
NetU4_33: U11.3(NO2) ; port nRF91_SWD.SWDCLK
NetU4_34: U11.15(NO1) ; port nRF91_SWD.SWDIO

Not connected (* = marked no-connect by the designer): J5 C6(VPP)*; P1 6* 7* 8*; U11 11(NO4)* 12(COM4)* 13(NC4)*

### Notes on the sheet
- ZyntelliTech
- File:
- Title:
- Date:
- Page
- Num:
- Total:
- Drawn By: Huzaifa Ali

### Library data of the parts
C59 C60 = C1005X7R1H104KT000F: as C29 on sheet 3.MCU NRF52840; ComponentLink1URL: https://www.lcsc.com/product-detail/Multilayer-Ceramic-Capacitors-MLCC-SMD-SMT_TDK-C1005X7R1H104KT000F_C361198.html; ComponentLink1Description: LCSC; Supplier 1: Avnet; Manufacturer Part Number: C1005X7R1H104KT000F; RoHS: No; Category: Ceramic Capacitors; Dielectric: X7R; Supplier Part Number 1: C1005X7R1H104KT000F; LCSC Part Number: C361198
J5 = SMN-303: NanoSIM SMD SIM Card Connectors; Manufacturer: XUNPU; Alternate Part Number: SIM8066-6-1-14-01-A; Manufacturer Part Number: SMN-303; Supplier 1: LCSC; LCSC: C266888
P1 = 20021321-00010C4LF: CONN RCPT 10POS 0.05 GOLD SMD; Manufacturer: Amphenol Communications Solutions; Item Type: Headers and Wire Housings; Gender: 4472Gender; Connector Type: 4640ConnectorType; Current Rating: 1A; Number of Contacts: 10NUMBER; Voltage Rating: 125V; Contact Resistance: 30mR; Insulation Resistance: 100MR; Pitch: 1.27mm; Stack Height: 4.3mm; Supplier: Digikey; LCSC Part Number: C598542; Manufacturer Part Number: 20021321-00010C4LF; RoHS: No; Stock: 9747; Pricing: 1=1.13, 10=0.963, 100=0.8184 (USD); Mounting Technology: 8Mount; Pins: 10NUMBER; Color: 46Colour; Contact Material: 153,157ConductorMaterial; Contact Plating: 157ConductorMaterial; Housing Color: 46Colour; Housing Material: 4896ConductorMaterial; Min Operating Temperature: -55°C; Max Operating Temperature: 125°C; Number of Positions: 10NUMBER; Number of Rows: 2NUMBER; Packaging: 10Packaging; Termination: 4558ConnectorType; Max Voltage Rating (AC): 125V; Length: 13.16mm; Height: 4.75mm; Depth: 3mm; Row Spacing: 1.27mm; Lead Free: 5697LeadFree; Reach SVHC Compliant: 4186SVHC; ComponentLink1URL: https://datasheet.octopart.com/20021321-00010C4LF-FCI-datasheet-27119701.pdf?src-supplier=Newark; ComponentLink1Description: https://datasheet.octopart.com/20021321-00010C4LF-FCI-datasheet-27119701.pdf?src-supplier=Newark; ComponentLink2URL: https://datasheet.octopart.com/20021321-00010C4LF-Amphenol-Communications-Solutions-datasheet-98396828.pdf?src-supplier=Element14; ComponentLink2Description: https://datasheet.octopart.com/20021321-00010C4LF-Amphenol-Communications-Solutions-datasheet-98396828.pdf?src-supplier=Element14; ComponentLink3URL: https://datasheet.octopart.com/20021321-00010C4LF-FCI-datasheet-21379677.pdf?src-supplier=Farnell; ComponentLink3Description: https://datasheet.octopart.com/20021321-00010C4LF-FCI-datasheet-21379677.pdf?src-supplier=Farnell; ComponentLink4URL: https://datasheet.octopart.com/20021321-00010C4LF-Amphenol-Communications-Solutions-datasheet-100449241.pdf?src-supplier=TME; ComponentLink4Description: https://datasheet.octopart.com/20021321-00010C4LF-Amphenol-Communications-Solutions-datasheet-100449241.pdf?src-supplier=TME
R17 R35 = RC0402FR-07100KL: as R22 on sheet 5.RGB_TEMP-HUMIDITY; RoHS: Yes; Category: Chip SMD Resistors; Case/Package: 0402; Case Code (Metric): 1005; Case Code (Imperial): 0402; Min Operating Temperature: -55°C; Max Operating Temperature: 155°C; Resistor Type: Thick Film; Tolerance: 1%; Packaging: Tape and Reel; Features: Moisture Resistant; Resistance Tolerance: 1%; Height: 0.016inch; Lead Free: Lead Free; RoHS Compliant: Yes; ComponentLink1URL: https://datasheet.ciiva.com/11819/0900766b80c66297-11819452.pdf?src-supplier=RSComponents; ComponentLink1Description: https://datasheet.ciiva.com/11819/0900766b80c66297-11819452.pdf?src-supplier=RSComponents; ComponentLink2URL: https://datasheet.ciiva.com/22747/1018594-22747509.pdf?src-supplier=Element14; ComponentLink2Description: https://datasheet.ciiva.com/22747/1018594-22747509.pdf?src-supplier=Element14; ComponentLink3URL: https://datasheet.ciiva.com/2453/pyu-r-int-thick-7-2453362.pdf?src-supplier=Digi-Key; ComponentLink3Description: https://datasheet.ciiva.com/2453/pyu-r-int-thick-7-2453362.pdf?src-supplier=Digi-Key; ComponentLink4URL: https://datasheet.ciiva.com/2453/pyu-r-int-thick-7-2453363.pdf?src-supplier=Digi-Key; ComponentLink4Description: https://datasheet.ciiva.com/2453/pyu-r-int-thick-7-2453363.pdf?src-supplier=Digi-Key; ComponentLink5URL: https://datasheet.ciiva.com/2453/pyu-r-int-thick-7-2453361.pdf?src-supplier=Digi-Key; ComponentLink5Description: https://datasheet.ciiva.com/2453/pyu-r-int-thick-7-2453361.pdf?src-supplier=Digi-Key; ComponentLink6URL: https://datasheet.ciiva.com/12667/pyu-rc0402-51-rohs-l-6-r-12667930.pdf?src-supplier=Mouser; ComponentLink6Description: https://datasheet.ciiva.com/12667/pyu-rc0402-51-rohs-l-6-r-12667930.pdf?src-supplier=Mouser; ComponentLink7URL: https://datasheet.ciiva.com/15189/getdatasheetpartid-323696-15189334.pdf?src-supplier=Verical; ComponentLink7Description: https://datasheet.ciiva.com/15189/getdatasheetpartid-323696-15189334.pdf?src-supplier=Verical; LCSC Part Number: C60491; Supplier 1: Mouser; Manufacturer Part Number: RC0402FR-07100KL; Stock 1: 7759549; Pricing 1: 1=0.10000, 10=0.01200, 50=0.01200, 100=0.00500, 1000=0.00300, 2500=0.00200, 10000=0.00100 (USD); Package Quantity: 1; Number of Terminations: 2; Termination: SMD/SMT; Max Power Dissipation: 63mW; Working Voltage: 50V; Series: RC; Construction: Rectangular; Technology: THICK FILM; Length: 0.039inch; Width: 0.02inch; Depth: 0.5mm; REACH SVHC: No SVHC; Military Standard: Not; Supplier Part Number 1: 603-RC0402FR-07100KL
SW1 = AYZ0102AGRLC: Miniature slide switch, SPDT, Right-Angle, ON-ON, 12V, 100mA; ComponentLink1URL: https://www.ckswitches.com/media/1431/ayz.pdf; ComponentLink1Description: Datasheet; ComponentLink2URL: N.A.; ComponentLink2Description: Supplier link; Digikey Part Number: 401-2012-1-ND; LCSC: C92658
TP2 = TEST POINT 0.5mm Dia: Test Point ON; Item Type: Test Point; Manufacturer Part Number: TEST POINT 0.5mm Dia
U10 = SMF05C.TCT: TVS DIODE 5VWM 12.5VC SC70-6; Manufacturer: Semtech; Direction: Unidirectional; Capacitance: 130pF; Reverse Breakdown Voltage: 6V; Number of Elements: 5; Element Configuration: Common Anode; Reverse Standoff Voltage: 5V; Clamping Voltage: 12.5V; Peak Pulse Power: 100W; Power Line Protection: No; Leakage Current: 5uA; Peak Pulse Current: 8A; Test Current: 1mA; ESD Protection: Yes; Diode Type: ZENER; Supplier 1: Digi-Key; Supplier Part Number 1: SMF05CCT-ND; Manufacturer Part Number: SMF05C.TCT; RoHS: Yes; Category: TVS Diodes; Stock 1: 164885; Pricing 1: 1=0.79000, 10=0.69300, 100=0.53130, 500=0.42000, 1000=0.33600 (USD); Mount: Surface Mount; Case/Package: SC; Number of Pins: 6; Min Operating Temperature: -55°C; Max Operating Temperature: 125°C; Packaging: Tape and Reel; Number of Channels: 5; Number of Unidirectional Channels: 5; Min Breakdown Voltage: 6V; Working Voltage: 5V; Polarity: Unidirectional; Max Reverse Leakage Current: 5uA; Max Breakdown Voltage: 6V; Voltage Rating (DC): 5V; Operating Supply Voltage: 5V; Resistor Type: Zener; Series: SMF; Clamping Voltage-Max: 12.5V; Length: 2mm; Width: 1.25mm; Height: 0.9mm; Depth: 1.25mm; Radiation Hardening: No; Lead Free: Lead Free; RoHS Compliant: Yes; ComponentLink1URL: https://datasheet.ciiva.com/338/smf05c-338385.pdf?src-supplier=Digi-Key; ComponentLink1Description: https://datasheet.ciiva.com/338/smf05c-338385.pdf?src-supplier=Digi-Key; ComponentLink2URL: https://datasheet.ciiva.com/18065/getdatasheetpartid-89007-18065142.pdf?src-supplier=Verical; ComponentLink2Description: https://datasheet.ciiva.com/18065/getdatasheetpartid-89007-18065142.pdf?src-supplier=Verical; ComponentLink3URL: https://datasheet.ciiva.com/338/smf05c-338386.pdf?src-supplier=Digi-Key; ComponentLink3Description: https://datasheet.ciiva.com/338/smf05c-338386.pdf?src-supplier=Digi-Key; ComponentLink4URL: https://datasheet.ciiva.com/338/smf05c-338387.pdf?src-supplier=Digi-Key; ComponentLink4Description: https://datasheet.ciiva.com/338/smf05c-338387.pdf?src-supplier=Digi-Key; ComponentLink5URL: https://datasheet.ciiva.com/16387/smf05c-16387308.pdf?src-supplier=Future+Electronics; ComponentLink5Description: https://datasheet.ciiva.com/16387/smf05c-16387308.pdf?src-supplier=Future+Electronics; LCSC: C85191
U11 = FSA2466UMX: Data / Audio Low-Voltage Dual DPDT Analog Switch; Manufacturer: ON Semiconductor; Part number IPS: 00000009986; Note: N.A.; Artikkelnr Noca: 15070069; Pad Count: 16; Part Number: FSA2466UMX; Manufacturer Part Number: FSA2466UMX; ComponentLink1URL: N.A.; ComponentLink1Description: Datasheet; ComponentLink2URL: N.A.; ComponentLink2Description: Supplier link; HelpURL: https://www.onsemi.com/pub/Collateral/FSA2466-D.PDF; Footprint Doc: UFQFN-16; LatestRevisionDate: 2019-05-15; Published: 2016-05-18; Value: FSA2466UMX; Supplier 1: Digi-Key; Supplier Part Number 1: FSA2466UMXCT-ND; Supplier 2: Mouser; Supplier Part Number 2: 512-FSA2466UMX; Component Class: Misc_ICs; PartId: 101900422; LCSC: C457657

## Nets that join several sheets
+3V3: 1.Power Source (8 pins), 2.Battery Management (R29.1 R31.1 R32.1), 4.Microcontroller-NRF9160 (11 pins), 3.MCU NRF52840 (11 pins), 5.RGB_TEMP-HUMIDITY (C25.1 U5.1), 6.Connectors (C60.1 P1.1 SW1.3 U11.14)
GND: 1.Power Source (30 pins), 2.Battery Management (10 pins), 4.Microcontroller-NRF9160 (73 pins), 3.MCU NRF52840 (31 pins), 5.RGB_TEMP-HUMIDITY (9 pins), 6.Connectors (13 pins)
SIM_1V8: 4.Microcontroller-NRF9160 (U4.49), 6.Connectors (C59.2 J5.C1 R17.1 U10.1)
VBAT: 1.Power Source (J3.3 Q4.3), 2.Battery Management (7 pins)
VBUS: 1.Power Source (D2.1 FB2.2 R12.1), 2.Battery Management (C51.2 R25.1 U12.1 U12.5), 3.MCU NRF52840 (C55.1 U7.AD2)
VDD_RF_FE: 1.Power Source (U9.A1), 4.Microcontroller-NRF9160 (8 pins)
VSYS: 1.Power Source (8 pins), 5.RGB_TEMP-HUMIDITY (LED1.4)
BAT_ALERT: 2.Battery Management (R29.2 U13.5), 4.Microcontroller-NRF9160 (U4.84)
COEX0: 4.Microcontroller-NRF9160 (R3.2 U3.6 U4.93), 3.MCU NRF52840 (U7.P23)
COEX1: 4.Microcontroller-NRF9160 (U4.92), 3.MCU NRF52840 (U7.U24)
COEX2: 1.Power Source (R34.2 U9.B2), 4.Microcontroller-NRF9160 (U4.91), 3.MCU NRF52840 (U7.Y23)
I2C_SCL: 2.Battery Management (R31.2 U13.7), 4.Microcontroller-NRF9160 (U4.20), 3.MCU NRF52840 (U7.R1), 5.RGB_TEMP-HUMIDITY (TP5.1 U5.2)
I2C_SDA: 2.Battery Management (R32.2 U13.8), 4.Microcontroller-NRF9160 (U4.19), 3.MCU NRF52840 (U7.P2), 5.RGB_TEMP-HUMIDITY (TP4.1 U5.3)
MCU_IF0: 4.Microcontroller-NRF9160 (R33.1), 3.MCU NRF52840 (U7.T2)
MCU_IF1: 4.Microcontroller-NRF9160 (R36.1), 3.MCU NRF52840 (U7.AD10)
MCU_IF2: 4.Microcontroller-NRF9160 (R37.1), 3.MCU NRF52840 (U7.AD16)
MCU_IF3: 4.Microcontroller-NRF9160 (R38.1), 3.MCU NRF52840 (U7.AC17)
MCU_IF4: 4.Microcontroller-NRF9160 (R39.1), 3.MCU NRF52840 (U7.AD22)
MCU_IF5: 4.Microcontroller-NRF9160 (R40.1), 3.MCU NRF52840 (U7.AC21)
MCU_IF6: 4.Microcontroller-NRF9160 (R41.1), 3.MCU NRF52840 (U7.AC15)
MCU_IF7: 4.Microcontroller-NRF9160 (R42.1), 3.MCU NRF52840 (U7.AD18)
NetR13_1: 4.Microcontroller-NRF9160 (R13.1), 6.Connectors (U11.7)
NetU4_33: 4.Microcontroller-NRF9160 (U4.33), 6.Connectors (U11.3)
NetU4_34: 4.Microcontroller-NRF9160 (U4.34), 6.Connectors (U11.15)
nRF52_RST: 3.MCU NRF52840 (C41.1 U7.AC13), 6.Connectors (U11.9)
nRF52_SWDCLK: 3.MCU NRF52840 (U7.AA24), 6.Connectors (U11.5)
nRF52_SWDIO: 3.MCU NRF52840 (U7.AC24), 6.Connectors (U11.1)
RXD: 4.Microcontroller-NRF9160 (R43.2 TP8.1), 3.MCU NRF52840 (U7.L1)
SIM_CLK: 4.Microcontroller-NRF9160 (U4.46), 6.Connectors (J5.C3 U10.4)
SIM_DET: 4.Microcontroller-NRF9160 (U4.45), 6.Connectors (J5.CD R17.2 TP2.1 U10.3)
SIM_IO: 4.Microcontroller-NRF9160 (U4.48), 6.Connectors (J5.C7 U10.5)
SIM_RST: 4.Microcontroller-NRF9160 (U4.43), 6.Connectors (J5.C2 U10.6)
STAT_RGB_B: 4.Microcontroller-NRF9160 (U4.89), 5.RGB_TEMP-HUMIDITY (Q3.1 R24.2)
STAT_RGB_G: 4.Microcontroller-NRF9160 (U4.88), 5.RGB_TEMP-HUMIDITY (Q2.1 R23.2)
STAT_RGB_R: 4.Microcontroller-NRF9160 (U4.87), 5.RGB_TEMP-HUMIDITY (Q1.1 R22.2)
TXD: 4.Microcontroller-NRF9160 (R44.2 TP9.1), 3.MCU NRF52840 (U7.K2)
TYPEC_N: 1.Power Source (TP6.1 U8.6), 3.MCU NRF52840 (U7.AD4)
TYPEC_P: 1.Power Source (TP7.1 U8.4), 3.MCU NRF52840 (U7.AD6)